# Altium schematic sheet Peripheral_Sheet.SchDoc
size 420 x 297 mm; SheetNumber: 4; SheetTotal: 5
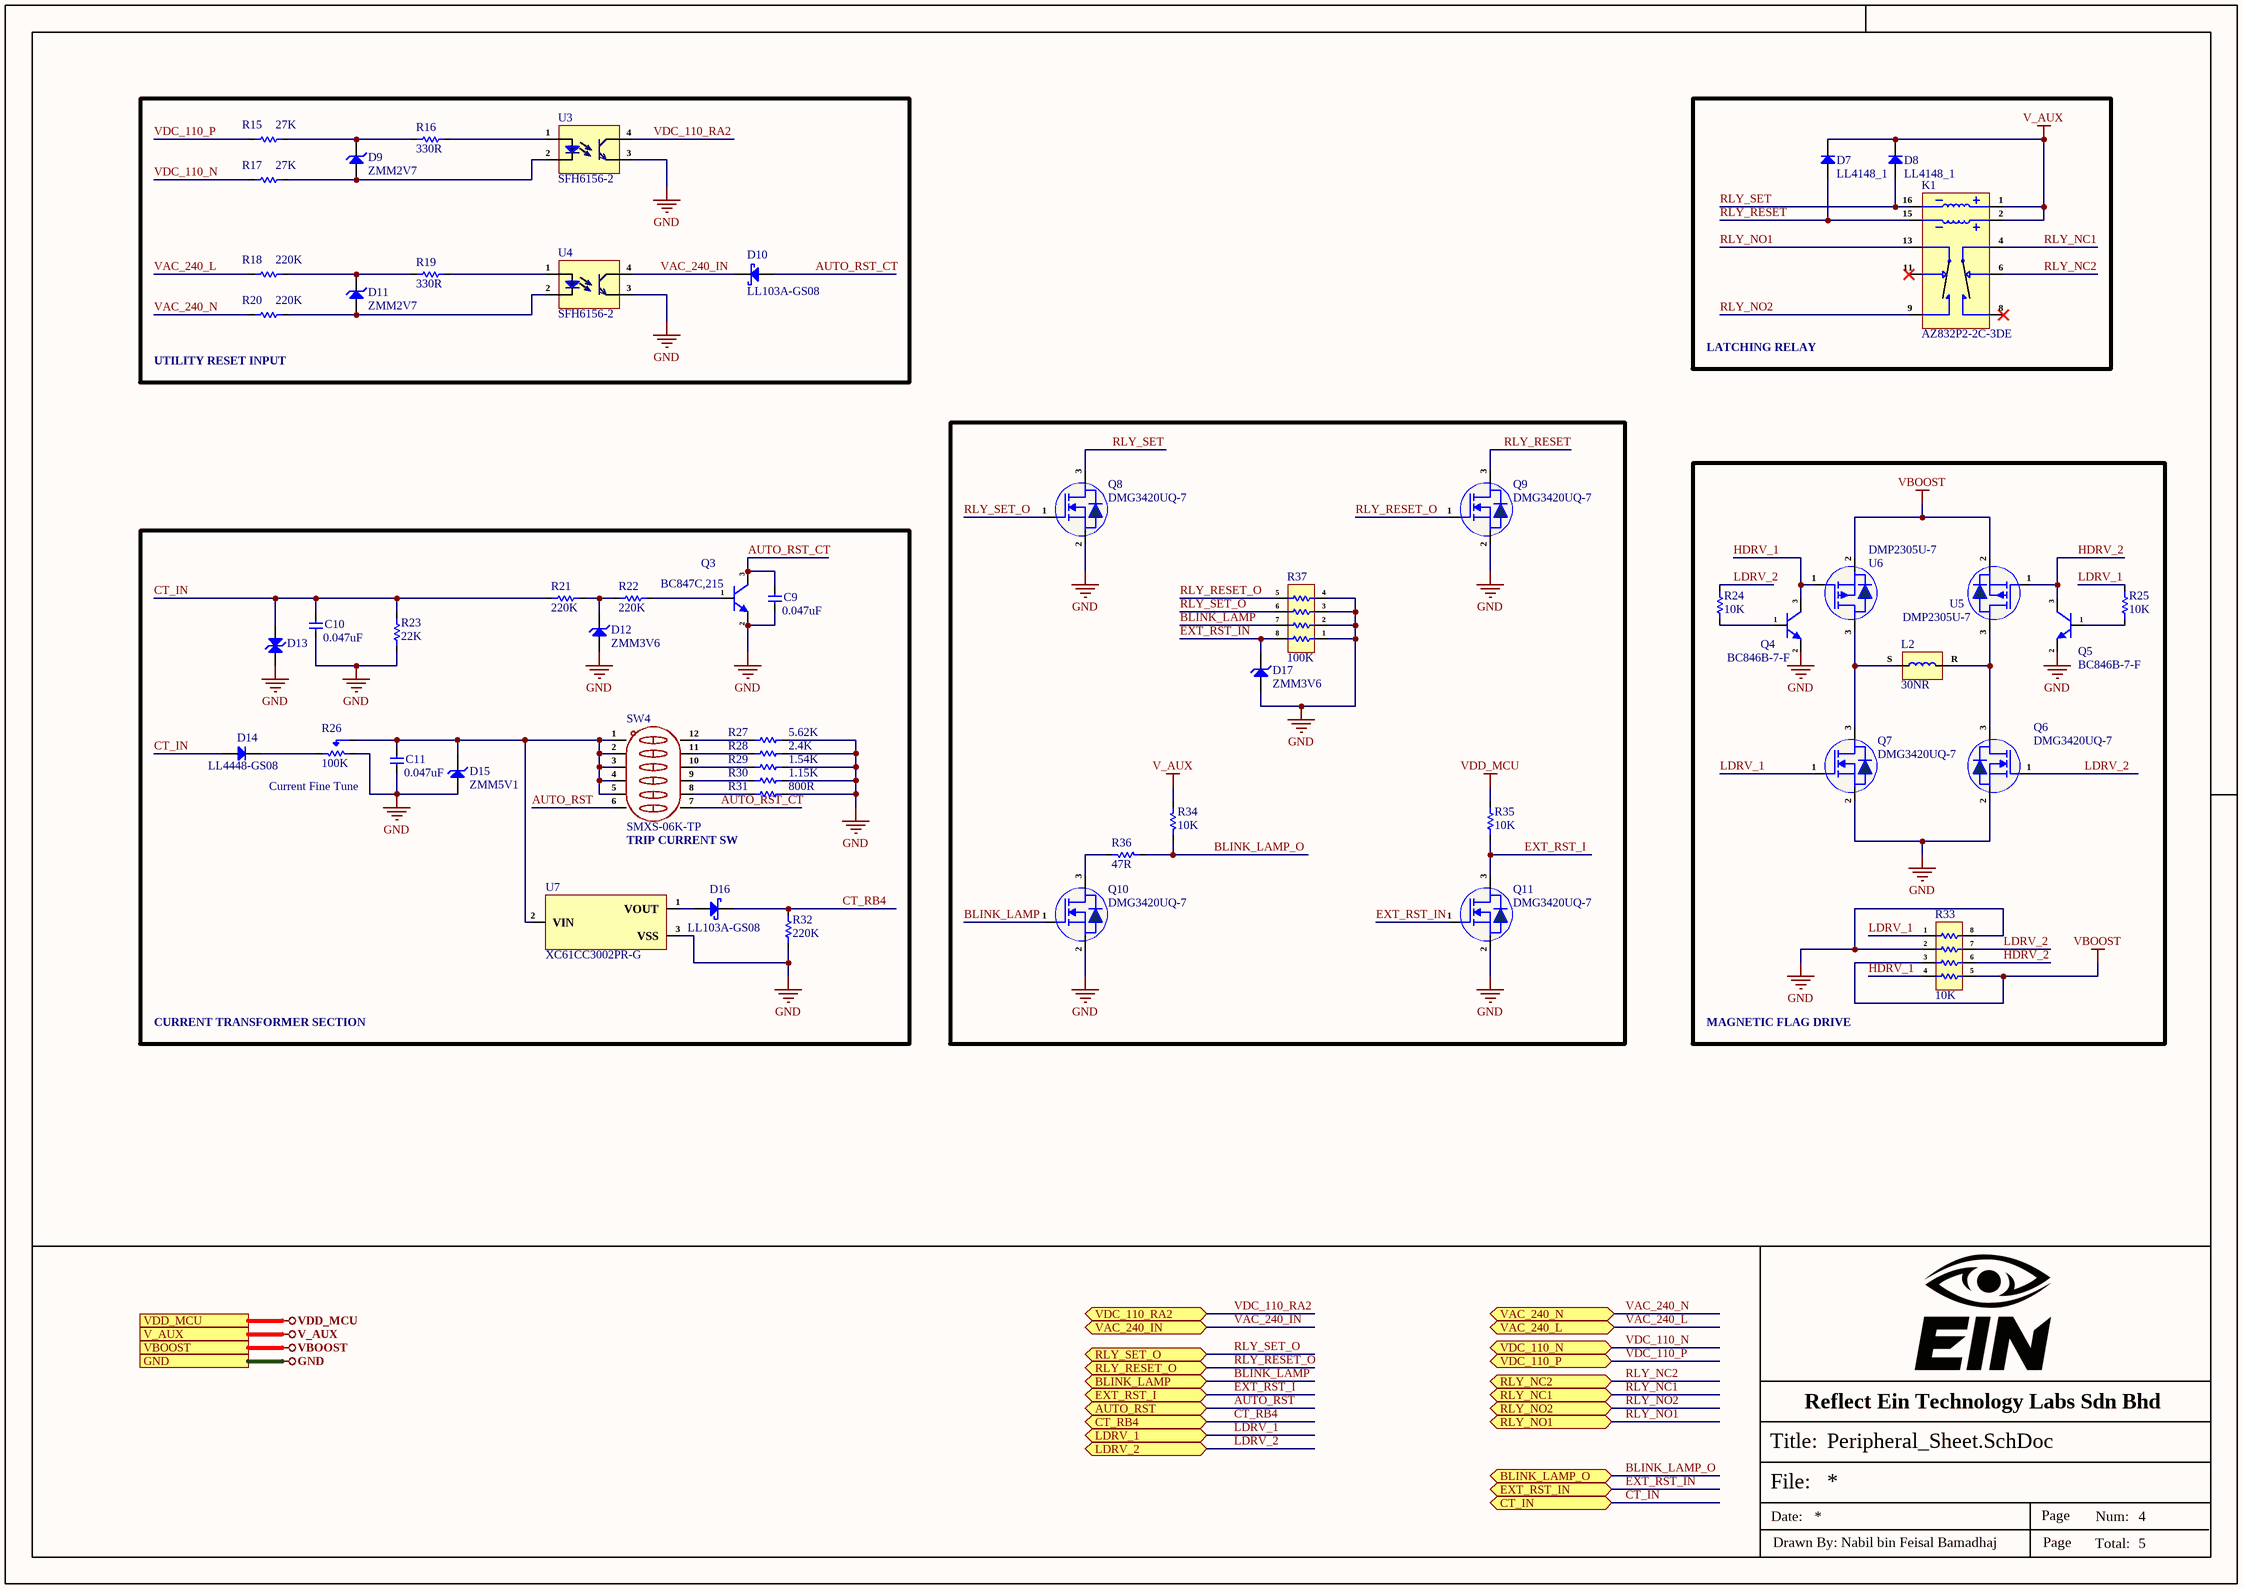
[diagram p0: Peripheral_Sheet.SchDoc]

## Parts
C9  0.047uF  [Cap-1206]
C10  0.047uF  [Cap-1206]
C11  0.047uF  [Cap-1206]
D7  LL4148_1  [LL-34]
D8  LL4148_1  [LL-34]
D9  ZMM2V7  [LL-34]
D10  LL103A-GS08  [LL-34]
D11  ZMM2V7  [LL-34]
D12  ZMM3V6  [LL-34]
D13  SMAJ110CA-E3/5A  [SMA Bi Directional]  (value not drawn)
D14  LL4448-GS08  [LL-34]
D15  ZMM5V1  [LL-34]
D16  LL103A-GS08  [LL-34]
D17  ZMM3V6  [LL-34]
K1  AZ832P2-2C-3DE  [AZ832P2-2C-3DE]
L2  30NR  [30NR]
Q3  BC847C,215  [SOT-23]
Q4  BC846B-7-F  [SOT-23]
Q5  BC846B-7-F  [SOT-23]
Q6  DMG3420UQ-7  [SOT-23]
Q7  DMG3420UQ-7  [SOT-23]
Q8  DMG3420UQ-7  [SOT-23]
Q9  DMG3420UQ-7  [SOT-23]
Q10  DMG3420UQ-7  [SOT-23]
Q11  DMG3420UQ-7  [SOT-23]
R15  27K  [Res-1206]
R16  330R  [Res-1206]
R17  27K  [Res-1206]
R18  220K  [Res-1206]
R19  330R  [Res-1206]
R20  220K  [Res-1206]
R21  220K  [Res-1206]
R22  220K  [Res-1206]
R23  22K  [Res-1206]
R24  10K  [Res-1206]
R25  10K  [Res-1206]
R26  100K  [T93YA104KT20]
R27  5.62K  [Res-1206]
R28  2.4K  [Res-1206]
R29  1.54K  [Res-1206]
R30  1.15K  [Res-1206]
R31  800R  [Res-1206]
R32  220K  [Res-1206]
R33  10K  [0603x4]
R34  10K  [Res-1206]
R35  10K  [Res-1206]
R36  47R  [Res-1206]
R37  100K  [YC164-JR-070RL]
SW4  SMXS-06K-TP  [SMXS-06K-TP]
U3  SFH6156-2  [SFH6156-2]
U4  SFH6156-2  [SFH6156-2]
U5  DMP2305U-7  [SOT-23]
U6  DMP2305U-7  [SOT-23]
U7  XC61CC3002PR-G  [SOT-89-3]

## Blocks framed on the sheet
UTILITY RESET INPUT: D9-D11 R15-R20 U3 U4
LATCHING RELAY: D7 D8 K1
MAGNETIC FLAG DRIVE: L2 Q4-Q7 R24 R25 R33 U5 U6

## Ports
AUTO_RST (bidir, see Top-Sheet[4B], Controller_Sheet[4D]), BLINK_LAMP (bidir, see Top-Sheet[4B], Controller_Sheet[4D]), BLINK_LAMP_O (bidir, see Top-Sheet[4B], Connector_Sheet[4D]), CT_IN (bidir, see Top-Sheet[4B], Connector_Sheet[4D]), CT_RB4 (bidir, see Top-Sheet[4B], Controller_Sheet[4D]), EXT_RST_I (bidir, see Top-Sheet[4B], Controller_Sheet[4D]), EXT_RST_IN (bidir, see Top-Sheet[4B], Connector_Sheet[4D]), GND (see Top-Sheet[4B], Connector_Sheet[1D], Controller_Sheet[1D], Power_Sheet[1D]), LDRV_1 (bidir, see Top-Sheet[4B], Controller_Sheet[4D]), LDRV_2 (bidir, see Top-Sheet[4B], Controller_Sheet[4D]), RLY_NC1 (bidir, see Top-Sheet[4B], Connector_Sheet[4D]), RLY_NC2 (bidir, see Top-Sheet[4B], Connector_Sheet[4D]), RLY_NO1 (bidir, see Top-Sheet[4B], Connector_Sheet[4D]), RLY_NO2 (bidir, see Top-Sheet[4B], Connector_Sheet[4D]), RLY_RESET_O (bidir, see Top-Sheet[4B], Controller_Sheet[4D]), RLY_SET_O (bidir, see Top-Sheet[4B], Controller_Sheet[4D]), V_AUX (see Top-Sheet[4A], Connector_Sheet[1D], Power_Sheet[1D]), VAC_240_IN (bidir, see Top-Sheet[4B], Controller_Sheet[4D]), VAC_240_L (bidir, see Top-Sheet[4B], Connector_Sheet[4D]), VAC_240_N (bidir, see Top-Sheet[4B], Connector_Sheet[4D]), VBOOST (see Top-Sheet[4B], Power_Sheet[1D]), VDC_110_N (bidir, see Top-Sheet[4B], Connector_Sheet[4D]), VDC_110_P (bidir, see Top-Sheet[4B], Connector_Sheet[4D]), VDC_110_RA2 (bidir, see Top-Sheet[4B], Controller_Sheet[4D]), VDD_MCU (see Top-Sheet[4A], Controller_Sheet[1D], Power_Sheet[1D])

## Nets
GND: C9.1 C10.1 C11.1 D12.2(A) D13.1(A) D15.2(A) D17.2(A) Q3.2(E) Q4.2(E) Q5.2(E) Q6.2(S) Q7.2(S) Q8.2(S) Q9.2(S) Q10.2(S) Q11.2(S) R23.1 R26.1(CCW) R27.2 R28.2 R29.2 R30.2 R31.2 R32.2 R33.2 R33.8 R37.1 R37.2 R37.3 R37.4 U3.3(E) U4.3(E) U7.3(VSS) ; port GND
V_AUX: D7.1(K) D8.1(K) K1.1 K1.2 R34.2 ; port V_AUX
VBOOST: R33.3 R33.5 U5.2(S) U6.2(S) ; port VBOOST
VDD_MCU: R35.2 ; port VDD_MCU
AUTO_RST: SW4.6 ; port AUTO_RST
AUTO_RST_CT: C9.2 D10.2(A) Q3.3(C) SW4.7
BLINK_LAMP: Q10.1(G) R37.7 ; port BLINK_LAMP
BLINK_LAMP_O: R34.1 R36.1 ; port BLINK_LAMP_O
CT_IN: C10.2 D13.2(A) D14.2(A) R21.2 R23.2 ; port CT_IN
CT_RB4: D16.1(K) R32.1 ; port CT_RB4
EXT_RST_I: Q11.3(D) R35.1 ; port EXT_RST_I
EXT_RST_IN: D17.1(K) Q11.1(G) R37.8 ; port EXT_RST_IN
HDRV_1: Q4.3(C) R33.4 U6.1(G)
HDRV_2: Q5.3(C) R33.6 U5.1(G)
LDRV_1: Q7.1(G) R25.2 R33.1 ; port LDRV_1
LDRV_2: Q6.1(G) R24.2 R33.7 ; port LDRV_2
RLY_NC1: K1.4 ; port RLY_NC1
RLY_NC2: K1.6 ; port RLY_NC2
RLY_NO1: K1.13 ; port RLY_NO1
RLY_NO2: K1.9 ; port RLY_NO2
RLY_RESET: D7.2(A) K1.15 Q9.3(D)
RLY_RESET_O: Q9.1(G) R37.5 ; port RLY_RESET_O
RLY_SET: D8.2(A) K1.16 Q8.3(D)
RLY_SET_O: Q8.1(G) R37.6 ; port RLY_SET_O
VAC_240_IN: D10.1(K) U4.4(C) ; port VAC_240_IN
VAC_240_L: R18.2 ; port VAC_240_L
VAC_240_N: R20.2 ; port VAC_240_N
VDC_110_N: R17.1 ; port VDC_110_N
VDC_110_P: R15.1 ; port VDC_110_P
VDC_110_RA2: U3.4(C) ; port VDC_110_RA2
NetC11_2: C11.2 D15.1(K) R26.2(Wiper) SW4.1 SW4.2 SW4.3 SW4.4 SW4.5 U7.2(VIN)
NetD9_1: D9.1(K) R15.2 R16.1
NetD9_2: D9.2(A) R17.2 U3.2(Ca)
NetD11_1: D11.1(K) R18.1 R19.1
NetD11_2: D11.2(A) R20.1 U4.2(Ca)
NetD12_1: D12.1(K) R21.1 R22.2
NetD14_1: D14.1(K) R26.3(CW)
NetD16_2: D16.2(A) U7.1(VOUT)
NetL2_R: L2.R Q6.3(D) U5.3(D)
NetL2_S: L2.S Q7.3(D) U6.3(D)
NetQ3_1: Q3.1(B) R22.1
NetQ4_1: Q4.1(B) R24.1
NetQ5_1: Q5.1(B) R25.1
NetQ10_3: Q10.3(D) R36.2
NetR16_2: R16.2 U3.1(An)
NetR19_2: R19.2 U4.1(An)
NetR27_1: R27.1 SW4.12
NetR28_1: R28.1 SW4.11
NetR29_1: R29.1 SW4.10
NetR30_1: R30.1 SW4.9
NetR31_1: R31.1 SW4.8

Not connected (* = marked no-connect by the designer): K1 8* 11*

## Notes on the sheet
- Current Fine Tune
- (near SW4) TRIP CURRENT SW
- CURRENT TRANSFORMER SECTION
- Reflect Ein Technology Labs Sdn Bhd
- File:
- Title:
- Date:
- Page
- Num:
- Total:
- Drawn By: Nabil bin Feisal Bamadhaj

## Library data of the parts
C9-C11 = CC1206JRX7R0BB473: CAP CER 0.047UF 100V X7R 1206; Manufacturer: Yageo; Tolerance: 5%; Capacitance: 47nF; Item Type: Capacitor; Supplier 1: Arrow Electronics; Manufacturer Part Number: CC1206JRX7R0BB473; RoHS: Yes; Category: Ceramic Capacitors; Stock 1: 6600; Pricing 1: 1=0.21620, 10=0.10530, 25=0.10420, 100=0.08480, 250=0.08390, 500=0.05860, 1000=0.05090, 3000=0.04900, 6000=0.02930 (USD); Mount: Surface Mount; Case/Package: 1206; Case Code (Imperial): 1206; Case Code (Metric): 3216; Min Operating Temperature: -55°C; Max Operating Temperature: 125°C; Packaging: Tape and Reel; Voltage Rating (DC): 100V; Dielectric: X7R; Termination: SMD/SMT; Resistor Type: Ceramic; Voltage Rating: 100V; Series: CC; Construction: Flat; Length: 3.2mm; Width: 1.6mm; Height: 0.85mm; Thickness: 0.037inch; Depth: 1.6mm; Radiation Hardening: No; RoHS Compliant: Yes; ComponentLink1URL: https://datasheet.ciiva.com/11465/upy-np0x7r-mv-100-to-630v-9-11465413.pdf?src-supplier=Avnet; ComponentLink1Description: https://datasheet.ciiva.com/11465/upy-np0x7r-mv-100-to-630v-9-11465413.pdf?src-supplier=Avnet; ComponentLink2URL: https://datasheet.ciiva.com/13210/upy-gp-np0-16v-to-50v-8-13210277.pdf?src-supplier=Mouser; ComponentLink2Description: https://datasheet.ciiva.com/13210/upy-gp-np0-16v-to-50v-8-13210277.pdf?src-supplier=Mouser; Supplier Part Number 1: CC1206JRX7R0BB473; LCSC Part Number: C577197
D7 D8 = LL4148_1: 100V 1V@50mA 4ns 300mA LL-34 Switching Diodes ROHS; Manufacturer: Yangzhou Yangjie Elec Tech; Manufacturer Part Number: LL4148; Item Type: Diode; Package: LL-34; LCSC Part Number: C211750; ComponentLink1Description: LCSC; ComponentLink1URL: https://www.lcsc.com/product-detail/Switching-Diodes_Yangzhou-Yangjie-Elec-Tech-LL4148_C211750.html
D9 D11 = ZMM2V7: Independent Type 2.5V~2.9V 500mW 2.7V LL-34 Zener Diodes ROHS; Manufacturer: HXY MOSFET; Item Type: Diode; Manufacturer Part Number: ZMM2V7; Package: LL-34; LCSC Part Number: C2891738; ComponentLink1Description: LCSC; ComponentLink1URL: https://www.lcsc.com/product-detail/Zener-Diodes_YONGYUTAI-ZMM2V7_C2891738.html
D10 D16 = LL103A-GS08: DIODE SCHOTTKY 40V 200MA SOD80; Manufacturer: Vishay; Item Type: Schottky Diodes; Body Material: Glass; Value: 50pF; Current Rating: 400A; Element Configuration: Single; Forward Voltage: 370mV; Max Forward Surge Current (Ifsm): 15A; Max Junction Temperature (Tj): 125°C; Max Power Dissipation: 400mW; Max Reverse Leakage Current: 5µA; Number of Elements: 1; Recovery Time: 10ns; Supplier: Avnet; LCSC Part Number: C2979792; Manufacturer Part Number: LL103A-GS08; RoHS: Compliant; Stock: 37500; Pricing: 12500=0.05045 (USD); Average Rectified Current: 200mA; China RoHS: Non-Compliant; Contact Plating: Silver, Tin; Diameter: 1.6mm; Forward Current: 200mA; Height: 1.6mm; Lead Free: Lead Free; Length: 3.7mm; Lifecycle Status: Production; Max Operating Temperature: 125°C; Max Output current: 200mA; Max Repetitive Reverse Voltage (Vrrm): 40V; Max Reverse Voltage (DC): 40V; Max Surge Current: 15A; Min Operating Temperature: -65°C; Mounting Technology: Surface Mount; Pins: 2; Number of Terminals: 2; Packaging: Cut Tape; Peak Non-Repetitive Surge Current: 15A; Peak Reverse Current: 5µA; Power Dissipation: 400mW; Radiation Hardening: No; REACH SVHC: Yes; Reverse Recovery Time: 10ns; Reverse Standoff Voltage: 40V; Reverse Voltage: 40V; Schedule B: 8541100070, 8541100070|8541100070|8541100070|8541100070|8541100070; Width: 1.6mm; ComponentLink1URL: https://datasheet.octopart.com:443/LL103A-GS08-Vishay-datasheet-181469840.pdf?src-supplier=Farnell; ComponentLink1Description: https://datasheet.octopart.com:443/LL103A-GS08-Vishay-datasheet-181469840.pdf?src-supplier=Farnell; ComponentLink2URL: https://datasheet.octopart.com:443/LL103A-GS08-Vishay-datasheet-10540872.pdf?src-supplier=Farnell; ComponentLink2Description: https://datasheet.octopart.com:443/LL103A-GS08-Vishay-datasheet-10540872.pdf?src-supplier=Farnell; ComponentLink3URL: https://datasheet.octopart.com:443/LL103A-GS08-Vishay-datasheet-8365623.pdf?src-supplier=Farnell; ComponentLink3Description: https://datasheet.octopart.com:443/LL103A-GS08-Vishay-datasheet-8365623.pdf?src-supplier=Farnell; ComponentLink4URL: https://datasheet.octopart.com:443/LL103A-GS08-Vishay-datasheet-11751478.pdf?src-supplier=_legacy+Avnet; ComponentLink4Description: https://datasheet.octopart.com:443/LL103A-GS08-Vishay-datasheet-11751478.pdf?src-supplier=_legacy+Avnet; ComponentLink5URL: https://datasheet.octopart.com:443/LL103A-GS08-Vishay-datasheet-181483661.pdf?src-supplier=IHS; ComponentLink5Description: https://datasheet.octopart.com:443/LL103A-GS08-Vishay-datasheet-181483661.pdf?src-supplier=IHS; ComponentLink6URL: https://datasheet.octopart.com:443/LL103A-GS08-Vishay-datasheet-62318247.pdf?src-supplier=Newark; ComponentLink6Description: https://datasheet.octopart.com:443/LL103A-GS08-Vishay-datasheet-62318247.pdf?src-supplier=Newark; ComponentLink7URL: https://datasheet.octopart.com:443/LL103A-GS08.-Vishay-datasheet-184398164.pdf?src-supplier=Newark; ComponentLink7Description: https://datasheet.octopart.com:443/LL103A-GS08.-Vishay-datasheet-184398164.pdf?src-supplier=Newark; ComponentLink8URL: https://datasheet.octopart.com:443/LL103A-GS08-Vishay-datasheet-21268782.pdf?src-supplier=Newark; ComponentLink8Description: https://datasheet.octopart.com:443/LL103A-GS08-Vishay-datasheet-21268782.pdf?src-supplier=Newark; ComponentLink9URL: https://datasheet.octopart.com:443/LL103A-GS08-Vishay-datasheet-7183.pdf?src-supplier=Newark; ComponentLink9Description: https://datasheet.octopart.com:443/LL103A-GS08-Vishay-datasheet-7183.pdf?src-supplier=Newark; ComponentLink10URL: https://datasheet.octopart.com:443/LL103A-GS08-Vishay-datasheet-5392692.pdf?src-supplier=element14; ComponentLink10Description: https://datasheet.octopart.com:443/LL103A-GS08-Vishay-datasheet-5392692.pdf?src-supplier=element14; ComponentLink11URL: https://datasheet.octopart.com:443/LL103A-GS08-Vishay-datasheet-159617103.pdf?src-supplier=element14+APAC; ComponentLink11Description: https://datasheet.octopart.com:443/LL103A-GS08-Vishay-datasheet-159617103.pdf?src-supplier=element14+APAC; ComponentLink12URL: https://datasheet.octopart.com:443/LL103A-GS08-Vishay-datasheet-42424840.pdf?src-supplier=TME; ComponentLink12Description: https://datasheet.octopart.com:443/LL103A-GS08-Vishay-datasheet-42424840.pdf?src-supplier=TME; ComponentLink13URL: https://datasheet.octopart.com:443/LL103A-GS08-Vishay-datasheet-14186831.pdf?src-supplier=iiiC; ComponentLink13Description: https://datasheet.octopart.com:443/LL103A-GS08-Vishay-datasheet-14186831.pdf?src-supplier=iiiC; ComponentLink14URL: https://datasheet.octopart.com:443/LL103A-GS08-Vishay-datasheet-10014030.pdf?src-supplier=RS+(Formerly+Allied+Electronics); ComponentLink14Description: https://datasheet.octopart.com:443/LL103A-GS08-Vishay-datasheet-10014030.pdf?src-supplier=RS+(Formerly+Allied+Electronics); ComponentLink15URL: https://datasheet.octopart.com:443/LL103A-GS08-Vishay-datasheet-72214.pdf?src-supplier=RS+(Formerly+Allied+Electronics); ComponentLink15Description: https://datasheet.octopart.com:443/LL103A-GS08-Vishay-datasheet-72214.pdf?src-supplier=RS+(Formerly+Allied+Electronics); ComponentLink16URL: http://sigma.octopart.com:80/rohs_statement/Vishay-company-15.pdf?src-supplier=Compliance+Statements; ComponentLink16Description: http://sigma.octopart.com:80/rohs_statement/Vishay-company-15.pdf?src-supplier=Compliance+Statements
D12 D17 = ZMM3V6: Independent Type 500mW 3.4V~3.8V 3.6V LL-34 Zener Diodes ROHS; Manufacturer: HXY MOSFET; Item Type: Diode; Manufacturer Part Number: ZMM3V6; Package: LL-34; LCSC Part Number: C5345988; ComponentLink1Description: LCSC; ComponentLink1URL: https://www.lcsc.com/product-detail/Zener-Diodes_HXY-MOSFET-ZMM3V6_C5345988.html
D13 = SMAJ110CA-E3/5A: TVS DIODE 110VWM 177VC DO214AC; Manufacturer: Vishay; Item Type: TVS Diodes; Breakdown Voltage: 128.5V; Clamping Voltage: 177V; Direction: Bidirectional; Element Configuration: Single; Leakage Current: 1µA; Max Breakdown Voltage: 135V; Max Forward Surge Current (Ifsm): 40A; Max Power Dissipation: 3.3W; Max Surge Current: 1.7A; Min Breakdown Voltage: 122V; Number of Bidirectional Channels: 1; Operating Supply Voltage: 110V; Peak Pulse Power: 300W; Power Line Protection: No; Test Current: 1mA; Supplier: DigiKey; LCSC Part Number: C6229597; Manufacturer Part Number: SMAJ110CA-E3/5A; RoHS: Compliant; Pricing: 7500=0.09372, 15000=0.08595, 22500=0.08198, 37500=0.07753, 52500=0.07489, 75000=0.07233 (USD); Case/Package: SMA; China RoHS: Non-Compliant; Composition: Zener; Lifecycle Status: Production; Max Operating Temperature: 150°C; Max Reverse Leakage Current: 1µA; Min Operating Temperature: -55°C; Number of Channels: 1; Number of Elements: 1; Pins: 2; Number of Terminals: 2; Packaging: Tape and Reel; Peak Pulse Current: 1.7A; Peak Reverse Current: 1µA; Polarity: Bidirectional; REACH SVHC: No; Reverse Breakdown Voltage: 122V; Reverse Standoff Voltage: 110V; ComponentLink1URL: https://datasheet.octopart.com:443/SMAJ110CA-E3-5A-Vishay-datasheet-155938759.pdf?src-supplier=IHS; ComponentLink1Description: https://datasheet.octopart.com:443/SMAJ110CA-E3-5A-Vishay-datasheet-155938759.pdf?src-supplier=IHS; ComponentLink2URL: https://datasheet.octopart.com:443/SMAJ110CA-E3-5A-Vishay-Semiconductor-datasheet-15599035.pdf?src-supplier=Upverter; ComponentLink2Description: https://datasheet.octopart.com:443/SMAJ110CA-E3-5A-Vishay-Semiconductor-datasheet-15599035.pdf?src-supplier=Upverter; ComponentLink3URL: http://sigma.octopart.com:80/rohs_statement/Vishay-company-15.pdf?src-supplier=Compliance+Statements; ComponentLink3Description: http://sigma.octopart.com:80/rohs_statement/Vishay-company-15.pdf?src-supplier=Compliance+Statements
D14 = LL4448-GS08: DIODE STANDARD 75V 150MA SOD80C; Manufacturer: Vishay; Item Type: Rectifier Diodes; Body Material: Glass; Value: 4pF; Current: 500mA; Element Configuration: Single; Forward Current: 300mA; Forward Voltage: 1V; Max Forward Surge Current (Ifsm): 2A; Max Junction Temperature (Tj): 175°C; Max Power Dissipation: 500mW; Max Repetitive Reverse Voltage (Vrrm): 100V; Max Reverse Leakage Current: 5µA; Number of Elements: 1; Recovery Time: 8ns; Supplier: Avnet; LCSC Part Number: C19078472; Manufacturer Part Number: LL4448-GS08; RoHS: Compliant; Stock: 12093; Pricing: 1=0.105, 25=0.072, 100=0.06, 250=0.053, 500=0.043 (USD); Average Rectified Current: 150mA; China RoHS: Non-Compliant; Contact Plating: Silver, Tin; Diameter: 1.6mm; Height: 1.6mm; Lead Free: Lead Free; Length: 3.683mm; Lifecycle Status: Production; Max Operating Temperature: 175°C; Max Output current: 150mA; Max Reverse Voltage (DC): 75V; Max Surge Current: 2A; Min Breakdown Voltage: 100V; Min Operating Temperature: -65°C; Mounting Technology: Surface Mount; Pins: 2; Number of Terminals: 2; Packaging: Cut Tape; Peak Non-Repetitive Surge Current: 2A; Peak Reverse Current: 5µA; Power Dissipation: 500mW; Radiation Hardening: No; REACH SVHC: No; Reverse Recovery Time: 8ns; Reverse Standoff Voltage: 75V; Reverse Voltage: 75V; Schedule B: 8541100070, 8541100070|8541100070|8541100070|8541100070|8541100070; Termination: SMD/SMT; Voltage: 75V; ComponentLink1URL: https://datasheet.octopart.com:443/LL4448-GS08-Vishay-datasheet-165827647.pdf?src-supplier=Newark; ComponentLink1Description: https://datasheet.octopart.com:443/LL4448-GS08-Vishay-datasheet-165827647.pdf?src-supplier=Newark; ComponentLink2URL: https://datasheet.octopart.com:443/LL4448-GS08-Vishay-datasheet-62318255.pdf?src-supplier=Newark; ComponentLink2Description: https://datasheet.octopart.com:443/LL4448-GS08-Vishay-datasheet-62318255.pdf?src-supplier=Newark; ComponentLink3URL: https://datasheet.octopart.com:443/LL4448-GS08-Vishay-datasheet-34180280.pdf?src-supplier=Newark; ComponentLink3Description: https://datasheet.octopart.com:443/LL4448-GS08-Vishay-datasheet-34180280.pdf?src-supplier=Newark; ComponentLink4URL: https://datasheet.octopart.com:443/LL4448-GS08-Vishay-datasheet-5440278.pdf?src-supplier=Newark; ComponentLink4Description: https://datasheet.octopart.com:443/LL4448-GS08-Vishay-datasheet-5440278.pdf?src-supplier=Newark; ComponentLink5URL: https://datasheet.octopart.com:443/LL4448-GS08-Vishay-Semiconductor-datasheet-33013835.pdf?src-supplier=Newark; ComponentLink5Description: https://datasheet.octopart.com:443/LL4448-GS08-Vishay-Semiconductor-datasheet-33013835.pdf?src-supplier=Newark; ComponentLink6URL: https://datasheet.octopart.com:443/LL4448-GS08-Vishay-datasheet-8477288.pdf?src-supplier=_legacy+Avnet; ComponentLink6Description: https://datasheet.octopart.com:443/LL4448-GS08-Vishay-datasheet-8477288.pdf?src-supplier=_legacy+Avnet; ComponentLink7URL: https://datasheet.octopart.com:443/LL4448-GS08-Vishay-datasheet-12511824.pdf?src-supplier=_legacy+Avnet; ComponentLink7Description: https://datasheet.octopart.com:443/LL4448-GS08-Vishay-datasheet-12511824.pdf?src-supplier=_legacy+Avnet; ComponentLink8URL: https://datasheet.octopart.com:443/LL4448-GS08-Vishay-datasheet-8854176.pdf?src-supplier=_legacy+Avnet; ComponentLink8Description: https://datasheet.octopart.com:443/LL4448-GS08-Vishay-datasheet-8854176.pdf?src-supplier=_legacy+Avnet; ComponentLink9URL: https://datasheet.octopart.com:443/LL4448-GS08-Vishay-datasheet-181483663.pdf?src-supplier=IHS; ComponentLink9Description: https://datasheet.octopart.com:443/LL4448-GS08-Vishay-datasheet-181483663.pdf?src-supplier=IHS; ComponentLink10URL: https://datasheet.octopart.com:443/LL4448-GS08-Vishay-datasheet-616916.pdf?src-supplier=element14; ComponentLink10Description: https://datasheet.octopart.com:443/LL4448-GS08-Vishay-datasheet-616916.pdf?src-supplier=element14; ComponentLink11URL: https://datasheet.octopart.com:443/LL4448-GS08-Vishay-datasheet-170554758.pdf?src-supplier=Burklin+Elektronik; ComponentLink11Description: https://datasheet.octopart.com:443/LL4448-GS08-Vishay-datasheet-170554758.pdf?src-supplier=Burklin+Elektronik; ComponentLink12URL: https://datasheet.octopart.com:443/LL4448-GS08-Vishay-datasheet-152532718.pdf?src-supplier=TME; ComponentLink12Description: https://datasheet.octopart.com:443/LL4448-GS08-Vishay-datasheet-152532718.pdf?src-supplier=TME; ComponentLink13URL: https://datasheet.octopart.com:443/LL4448-GS08-Vishay-datasheet-41857211.pdf?src-supplier=TME; ComponentLink13Description: https://datasheet.octopart.com:443/LL4448-GS08-Vishay-datasheet-41857211.pdf?src-supplier=TME; ComponentLink14URL: https://datasheet.octopart.com:443/LL4448-GS08-Vishay-datasheet-101751515.pdf?src-supplier=Future+Electronics; ComponentLink14Description: https://datasheet.octopart.com:443/LL4448-GS08-Vishay-datasheet-101751515.pdf?src-supplier=Future+Electronics; ComponentLink15URL: https://datasheet.octopart.com:443/LL4448-GS08-Vishay-datasheet-9640167.pdf?src-supplier=RS+(Formerly+Allied+Electronics); ComponentLink15Description: https://datasheet.octopart.com:443/LL4448-GS08-Vishay-datasheet-9640167.pdf?src-supplier=RS+(Formerly+Allied+Electronics); ComponentLink16URL: https://datasheet.octopart.com:443/LL4448-GS08-Vishay-datasheet-76570.pdf?src-supplier=RS+(Formerly+Allied+Electronics); ComponentLink16Description: https://datasheet.octopart.com:443/LL4448-GS08-Vishay-datasheet-76570.pdf?src-supplier=RS+(Formerly+Allied+Electronics); ComponentLink17URL: http://sigma.octopart.com:80/rohs_statement/Vishay-company-15.pdf?src-supplier=Compliance+Statements; ComponentLink17Description: http://sigma.octopart.com:80/rohs_statement/Vishay-company-15.pdf?src-supplier=Compliance+Statements
D15 = ZMM5V1: Independent 4.8V~5.4V 500mW 5.1V LL-34 Single Zener Diodes RoHS; Manufacturer: HXY MOSFET; Item Type: Diode; Manufacturer Part Number: ZMM5V1; Package: LL-34; LCSC Part Number: C5345992; ComponentLink1Description: LCSC; ComponentLink1URL: https://www.lcsc.com/product-detail/C5345992.html?s_z=n_ZMM5V1
K1 = AZ832P2-2C-3DE: Magnetic Latching Relays ROHS; Manufacturer: ZETTLER; Item Type: Relay; Manufacturer Part Number: AZ832P2-2C-3DE; Package: Custom; LCSC Part Number: C20262850; ComponentLink1Description: LCSC; ComponentLink1URL: https://www.lcsc.com/product-detail/Magnetic-Latching-Relays_ZETTLER-AZ832P2-2C-3DE_C20262850.html?s_z=n_AZ832P2-2C-3DE
L2 = 30NR: Magnetic Status Indicator
Q3 = BC847C,215: TRANS NPN 45V 0.1A TO-236AB; Manufacturer: Nexperia; Item Type: BJTs; Polarity: 5054Direction; Supplier: Future Electronics; LCSC Part Number: C8664; Manufacturer Part Number: BC847C,215; RoHS: Yes; Stock: 18000; Pricing: 3000=0.0084, 12000=0.0081, 30000=0.0079, 75000=0.0077, 120000=0.0074 (USD); Pins: 3NUMBER; Packaging: 13Packaging; RoHS Compliant: Yes; ComponentLink1URL: http://www.farnell.com/datasheets/1856333.pdf?src-supplier=Farnell; ComponentLink1Description: http://www.farnell.com/datasheets/1856333.pdf?src-supplier=Farnell; ComponentLink2URL: https://assets.nexperia.com/documents/data-sheet/BC847_SER.pdf?src-supplier=Digikey; ComponentLink2Description: https://assets.nexperia.com/documents/data-sheet/BC847_SER.pdf?src-supplier=Digikey; ComponentLink3URL: https://datasheet.octopart.com/BC847C%2C215-NXP-Semiconductors-datasheet-20734447.pdf?src-supplier=Farnell; ComponentLink3Description: https://datasheet.octopart.com/BC847C%2C215-NXP-Semiconductors-datasheet-20734447.pdf?src-supplier=Farnell; ComponentLink4URL: https://datasheet.octopart.com/BC847C%2C215-Nexperia-datasheet-164345412.pdf?src-supplier=Future+Electronics; ComponentLink4Description: https://datasheet.octopart.com/BC847C%2C215-Nexperia-datasheet-164345412.pdf?src-supplier=Future+Electronics; ComponentLink5URL: https://datasheet.octopart.com/BC847C%2C215-Nexperia-datasheet-11982477.pdf?src-supplier=Newark; ComponentLink5Description: https://datasheet.octopart.com/BC847C%2C215-Nexperia-datasheet-11982477.pdf?src-supplier=Newark; ComponentLink6URL: https://datasheet.octopart.com/BC847C%2C215-Nexperia-datasheet-5341283.pdf?src-supplier=TME; ComponentLink6Description: https://datasheet.octopart.com/BC847C%2C215-Nexperia-datasheet-5341283.pdf?src-supplier=TME
Q4 Q5 = BC846B-7-F: TRANS NPN 65V 0.1A SOT23-3; Manufacturer: Diodes; Item Type: Transistors; Supplier: Future Electronics; Supplier Part Number: 3888237; Manufacturer Part Number: BC846B-7-F; RoHS: Yes; Category: BJTs; Stock: 4416000; Pricing: 3000=0.0363, 12000=0.0348, 45000=0.0335, 120000=0.0325, 300000=0.0309 (USD); ComponentLink1URL: https://datasheet.ciiva.com/15139/getdatasheetpartid-139519-15139459.pdf?src-supplier=Verical; ComponentLink1Description: https://datasheet.ciiva.com/15139/getdatasheetpartid-139519-15139459.pdf?src-supplier=Verical; ComponentLink2URL: https://datasheet.ciiva.com/22711/1911717-22711685.pdf?src-supplier=Element14; ComponentLink2Description: https://datasheet.ciiva.com/22711/1911717-22711685.pdf?src-supplier=Element14; LCSC Part Number: C183643
Q6-Q11 = DMG3420UQ-7: MOSFET BVDSS: 8V~24V SOT23 T&R 3; Manufacturer: Diodes; Item Type: MOSFETs; Supplier: Digikey; LCSC Part Number: C5157847; Manufacturer Part Number: DMG3420UQ-7; RoHS: Yes; Stock: 5879; Pricing: 1=0.45, 10=0.276, 100=0.1748, 500=0.1308, 1000=0.11658 (USD); RoHS Compliant: Yes
R15 R17 = FRC1206F2702TS: 250mW Thick Film Resistors 200V ±100ppm/℃ ±1% 27kΩ 1206 Chip Resistor - Surface Mount ROHS; Manufacturer: FOJAN; Manufacturer Part Number: FRC1206F2702TS; Package: 1206; LCSC Part Number: C2960927; Item Type: Resistor; ComponentLink1Description: LCSC; ComponentLink1URL: https://www.lcsc.com/product-detail/Chip-Resistor-Surface-Mount_FOJAN-FRC1206F2702TS_C2960927.html
R16 R19 = FRC1206F3300TS: 250mW Thick Film Resistors 200V ±100ppm/℃ ±1% 330Ω 1206 Chip Resistor - Surface Mount ROHS; Manufacturer: FOJAN; Manufacturer Part Number: FRC1206F3300TS; Package: 1206; LCSC Part Number: C2933675; Item Type: Resistor; ComponentLink1Description: LCSC; ComponentLink1URL: https://www.lcsc.com/product-detail/Chip-Resistor-Surface-Mount_FOJAN-FRC1206F3300TS_C2933675.html
R18 R20-R22 R32 = RT1206BRD07220KL: RES SMD 220K OHM 0.1% 1/4W 1206; Manufacturer: Yageo; Item Type: Resistors; Voltage Rating (DC): 200V; Supplier: Digikey; LCSC Part Number: C309663; Manufacturer Part Number: RT1206BRD07220KL; RoHS: Yes; Stock: 10004; Pricing: 1=0.34, 10=0.225, 50=0.1816, 100=0.1663, 500=0.1326, 1000=0.11628 (USD); Lead Free: 5697LeadFree; ComponentLink1URL: https://datasheet.ciiva.com/2587/pyu-rt-1-to-0-05-rohs-l-5-2587527.pdf?src-supplier=Digikey; ComponentLink1Description: https://datasheet.ciiva.com/2587/pyu-rt-1-to-0-05-rohs-l-5-2587527.pdf?src-supplier=Digikey
R23 = RT1206BRD0722KL: RES SMD 22K OHM 0.1% 1/4W 1206; Manufacturer: Yageo Group; Item Type: Resistors; Max Power Dissipation: 250mW; Value: 22kΩ; Temperature Coefficient: 25ppm/°C; Voltage Rating: 200V; Supplier: Arrow Electronics; LCSC Part Number: C870559; Manufacturer Part Number: RT1206BRD0722KL; RoHS: Compliant; Stock: 470; Pricing: 1=0.0714, 10=0.054, 25=0.051, 100=0.051, 250=0.046 (USD); Case/Package: 1206; Case Code (Imperial): 1206; Case Code (Metric): 3216; China RoHS: Non-Compliant; Composition: Thin Film; Features: Moisture Resistant; Height: 550µm; Lead Free: Lead Free; Length: 3.0988mm; Lifecycle Status: Production; Max Operating Temperature: 155°C; Min Operating Temperature: -55°C; Mounting Technology: Surface Mount; Number of Terminals: 2; Number of Terminations: 2; Power Dissipation: 250mW; Power Rating: 250mW; REACH SVHC: Yes; Schedule B: 8533210045, 8533210045|8533210045|8533210045|8533210045|8533210045; Termination: SMD/SMT; Tolerance: 0.1%; Voltage Rating (DC): 200V; Width: 1.6mm; Working Voltage: 200V; ComponentLink1URL: https://datasheet.octopart.com:443/RT1206BRD0722KL-Yageo-datasheet-176402239.pdf?src-supplier=Newark; ComponentLink1Description: https://datasheet.octopart.com:443/RT1206BRD0722KL-Yageo-datasheet-176402239.pdf?src-supplier=Newark; ComponentLink2URL: https://datasheet.octopart.com:443/RT1206BRD0722KL-Yageo-datasheet-96443642.pdf?src-supplier=Upverter; ComponentLink2Description: https://datasheet.octopart.com:443/RT1206BRD0722KL-Yageo-datasheet-96443642.pdf?src-supplier=Upverter; ComponentLink3URL: https://datasheet.octopart.com:443/RT1206BRD0722KL-Yageo-datasheet-169971040.pdf?src-supplier=Future+Electronics; ComponentLink3Description: https://datasheet.octopart.com:443/RT1206BRD0722KL-Yageo-datasheet-169971040.pdf?src-supplier=Future+Electronics; ComponentLink4URL: https://datasheet.octopart.com:443/RT1206BRD0722KL-Yageo-Group-datasheet-141265893.pdf?src-supplier=ODG+(Origin+Data+Global); ComponentLink4Description: https://datasheet.octopart.com:443/RT1206BRD0722KL-Yageo-Group-datasheet-141265893.pdf?src-supplier=ODG+(Origin+Data+Global); ComponentLink5URL: https://datasheet.octopart.com/RT1206BRD0722KL-Yageo-datasheet-86813807.pdf; ComponentLink5Description: https://datasheet.octopart.com/RT1206BRD0722KL-Yageo-datasheet-86813807.pdf; ComponentLink6URL: http://sigma.octopart.com:80/rohs_statement/Yageo-company-2.pdf?src-supplier=Compliance+Statements; ComponentLink6Description: http://sigma.octopart.com:80/rohs_statement/Yageo-company-2.pdf?src-supplier=Compliance+Statements; ComponentLink7URL: http://sigma.octopart.com:80/conflict_mineral_statement/Yageo-company-3.pdf?src-supplier=Compliance+Statements; ComponentLink7Description: http://sigma.octopart.com:80/conflict_mineral_statement/Yageo-company-3.pdf?src-supplier=Compliance+Statements
R24 R25 R34 R35 = AC1206FR-7W10KL: RES 10K OHM 1% 1/2W 1206; Manufacturer: Yageo; Item Type: Resistors; Value: 10kR; Supplier: Mouser; LCSC Part Number: C326700; Manufacturer Part Number: AC1206FR-7W10KL; RoHS: No; Stock: 10222; Pricing: 1=0.14, 10=0.052, 50=0.052, 100=0.029, 1000=0.018, 10000=0.011 (USD); Case/Package: 340Case; Packaging: 10Packaging
R26 = T93YA104KT20: TRIMMER 100K OHM 0.5W PC PIN TOP; Manufacturer: Vishay Sfernice; Item Type: Potensiometer; Value: 100kR; Tolerance: 10%; Power Rating: 500mW; Voltage Rating: 250V; Number of Turns: 21; Temperature Coefficient: 100ppm/°C; Supplier: Future Electronics; LCSC Part Number: C7061693; Manufacturer Part Number: T93YA104KT20; RoHS: Yes; Stock: 500; Pricing: 500=0.835, 1000=0.82, 1500=0.815, 2000=0.81, 2500=0.795 (USD); Mounting Technology: PCB,Through Hole; Min Operating Temperature: -55°C; Max Operating Temperature: 155°C; Packaging: Rail/Tube; Series: T93; Technology: CERMET; Package Quantity: 50; Resistor Type: Cermet; Taper: Linear; Termination: Pin; Max Power Dissipation: 500mW; Resistance Tolerance: 10%; Voltage Rating (AC): 250V; Length: 0.382inch; Width: 0.197inch; Height: 0.386inch; Depth: 5mm; Radiation Hardening: No; Lead Free: Lead Free; RoHS Compliant: Yes; Reach SVHC Compliant: Unknown; ComponentLink1URL: https://datasheet.ciiva.com/11831/0900766b80ed9ad6-11831453.pdf?src-supplier=Rs; ComponentLink1Description: https://datasheet.ciiva.com/11831/0900766b80ed9ad6-11831453.pdf?src-supplier=Rs; ComponentLink2URL: https://datasheet.ciiva.com/2156/t93-2156473.pdf?src-supplier=Digikey; ComponentLink2Description: https://datasheet.ciiva.com/2156/t93-2156473.pdf?src-supplier=Digikey; ComponentLink3URL: https://datasheet.ciiva.com/16367/t93-16367128.pdf?src-supplier=Future+Electronics; ComponentLink3Description: https://datasheet.ciiva.com/16367/t93-16367128.pdf?src-supplier=Future+Electronics
R27 = RT1206BRD075K62L: RES SMD 5.62K OHM 0.1% 1/4W 1206; Manufacturer: Yageo Group; Item Type: Resistors; Power Dissipation: 250mW; Value: 5.62kΩ; Temperature Coefficient: 25ppm/°C; Voltage Rating: 200V; Supplier: DigiKey; LCSC Part Number: C870815; Manufacturer Part Number: RT1206BRD075K62L; RoHS: Compliant; Pricing: 5000=0.0862 (USD); Case/Package: 1206; Case Code (Imperial): 1206; Case Code (Metric): 3216; China RoHS: Non-Compliant; Composition: Thin Film; Contact Plating: Tin; Height: 550µm; Lead Free: Lead Free; Length: 3.2mm; Lifecycle Status: Production; Max Operating Temperature: 155°C; Min Operating Temperature: -55°C; Mounting Technology: Surface Mount; Number of Terminals: 2; Power Rating: 250mW; Radiation Hardening: No; REACH SVHC: Yes; Termination: SMD/SMT; Tolerance: 0.1%; Voltage Rating (DC): 200V; Weight: 16.187578mg; Width: 1.6mm; Working Voltage: 200V; ComponentLink1URL: https://datasheet.octopart.com:443/RT1206BRD075K62L-Yageo-datasheet-176402239.pdf?src-supplier=IHS; ComponentLink1Description: https://datasheet.octopart.com:443/RT1206BRD075K62L-Yageo-datasheet-176402239.pdf?src-supplier=IHS; ComponentLink2URL: https://datasheet.octopart.com:443/RT1206BRD075K62L-Yageo-datasheet-96443642.pdf?src-supplier=Upverter; ComponentLink2Description: https://datasheet.octopart.com:443/RT1206BRD075K62L-Yageo-datasheet-96443642.pdf?src-supplier=Upverter; ComponentLink3URL: https://datasheet.octopart.com:443/RT1206BRD075K62L-Yageo-Group-datasheet-141265893.pdf?src-supplier=ODG+(Origin+Data+Global); ComponentLink3Description: https://datasheet.octopart.com:443/RT1206BRD075K62L-Yageo-Group-datasheet-141265893.pdf?src-supplier=ODG+(Origin+Data+Global); ComponentLink4URL: https://datasheet.octopart.com/RT1206BRD075K62L-Yageo-datasheet-86813807.pdf; ComponentLink4Description: https://datasheet.octopart.com/RT1206BRD075K62L-Yageo-datasheet-86813807.pdf; ComponentLink5URL: http://sigma.octopart.com:80/conflict_mineral_statement/Yageo-company-3.pdf?src-supplier=Compliance+Statements; ComponentLink5Description: http://sigma.octopart.com:80/conflict_mineral_statement/Yageo-company-3.pdf?src-supplier=Compliance+Statements; ComponentLink6URL: http://sigma.octopart.com:80/rohs_statement/Yageo-company-2.pdf?src-supplier=Compliance+Statements; ComponentLink6Description: http://sigma.octopart.com:80/rohs_statement/Yageo-company-2.pdf?src-supplier=Compliance+Statements
R28 = RT1206BRD072K4L: RES SMD 2.4K OHM 0.1% 1/4W 1206; Manufacturer: Yageo Group; Item Type: Resistors; Power Dissipation: 250mW; Value: 2.4kΩ; Temperature Coefficient: 25ppm/°C; Voltage Rating: 200V; Supplier: DigiKey; LCSC Part Number: C870627; Manufacturer Part Number: RT1206BRD072K4L; RoHS: Compliant; Stock: 4074; Pricing: 1=0.36, 10=0.255, 25=0.1796, 50=0.157, 100=0.1464, 250=0.1326, 500=0.1173 (USD); Case/Package: 1206; Case Code (Imperial): 1206; Case Code (Metric): 3216; China RoHS: Non-Compliant; Composition: Thin Film; Height: 550µm; Lead Free: Lead Free; Length: 3.1mm; Lifecycle Status: Production; Max Operating Temperature: 155°C; Min Operating Temperature: -55°C; Mounting Technology: Surface Mount; Number of Terminals: 2; Power Rating: 250mW; REACH SVHC: Yes; Termination: SMD/SMT; Tolerance: 0.1%; Voltage Rating (DC): 200V; Weight: 16.187578mg; Width: 1.6mm; Working Voltage: 200V; ComponentLink1URL: https://datasheet.octopart.com:443/RT1206BRD072K4L-Yageo-datasheet-176402239.pdf?src-supplier=Newark; ComponentLink1Description: https://datasheet.octopart.com:443/RT1206BRD072K4L-Yageo-datasheet-176402239.pdf?src-supplier=Newark; ComponentLink2URL: https://datasheet.octopart.com:443/RT1206BRD072K4L-Yageo-datasheet-96443642.pdf?src-supplier=Upverter; ComponentLink2Description: https://datasheet.octopart.com:443/RT1206BRD072K4L-Yageo-datasheet-96443642.pdf?src-supplier=Upverter; ComponentLink3URL: https://datasheet.octopart.com:443/RT1206BRD072K4L-Yageo-Group-datasheet-141265893.pdf?src-supplier=ODG+(Origin+Data+Global); ComponentLink3Description: https://datasheet.octopart.com:443/RT1206BRD072K4L-Yageo-Group-datasheet-141265893.pdf?src-supplier=ODG+(Origin+Data+Global); ComponentLink4URL: https://datasheet.octopart.com/RT1206BRD072K4L-Yageo-datasheet-86813807.pdf; ComponentLink4Description: https://datasheet.octopart.com/RT1206BRD072K4L-Yageo-datasheet-86813807.pdf; ComponentLink5URL: http://sigma.octopart.com:80/rohs_statement/Yageo-company-2.pdf?src-supplier=Compliance+Statements; ComponentLink5Description: http://sigma.octopart.com:80/rohs_statement/Yageo-company-2.pdf?src-supplier=Compliance+Statements; ComponentLink6URL: http://sigma.octopart.com:80/conflict_mineral_statement/Yageo-company-3.pdf?src-supplier=Compliance+Statements; ComponentLink6Description: http://sigma.octopart.com:80/conflict_mineral_statement/Yageo-company-3.pdf?src-supplier=Compliance+Statements
R29 = RT1206BRD071K54L: RES SMD 1.54K OHM 0.1% 1/4W 1206; Manufacturer: Yageo Group; Item Type: Resistors; Max Power Dissipation: 250mW; Value: 1.54kΩ; Temperature Coefficient: 25ppm/°C; Voltage Rating: 200V; Supplier: Arrow Electronics; LCSC Part Number: C870506; Manufacturer Part Number: RT1206BRD071K54L; RoHS: Compliant; Stock: 10000; Pricing: 5000=0.0623, 10000=0.06 (USD); Case/Package: 1206; Case Code (Imperial): 1206; Case Code (Metric): 3216; China RoHS: Non-Compliant; Composition: Thin Film; Contact Plating: Tin; Depth: 1.6mm; Features: Moisture Resistant; Height: 550µm; Lead Free: Lead Free; Length: 3.0988mm; Lifecycle Status: Production; Max Operating Temperature: 155°C; Military Standard: Not; Min Operating Temperature: -55°C; Mounting Technology: Surface Mount; Number of Terminals: 2; Number of Terminations: 2; Power Dissipation: 250mW; Power Rating: 250mW; Radiation Hardening: No; REACH SVHC: Yes; Termination: SMD/SMT; Tolerance: 0.1%; Voltage Rating (DC): 200V; Weight: 16.187578mg; Width: 1.6mm; Working Voltage: 200V; ComponentLink1URL: https://datasheet.octopart.com:443/RT1206BRD071K54L-Yageo-datasheet-176402239.pdf?src-supplier=IHS; ComponentLink1Description: https://datasheet.octopart.com:443/RT1206BRD071K54L-Yageo-datasheet-176402239.pdf?src-supplier=IHS; ComponentLink2URL: https://datasheet.octopart.com:443/RT1206BRD071K54L-Yageo-datasheet-96443642.pdf?src-supplier=Upverter; ComponentLink2Description: https://datasheet.octopart.com:443/RT1206BRD071K54L-Yageo-datasheet-96443642.pdf?src-supplier=Upverter; ComponentLink3URL: https://datasheet.octopart.com:443/RT1206BRD071K54L-Yageo-Group-datasheet-141265893.pdf?src-supplier=ODG+(Origin+Data+Global); ComponentLink3Description: https://datasheet.octopart.com:443/RT1206BRD071K54L-Yageo-Group-datasheet-141265893.pdf?src-supplier=ODG+(Origin+Data+Global); ComponentLink4URL: https://datasheet.octopart.com/RT1206BRD071K54L-Yageo-datasheet-86813807.pdf; ComponentLink4Description: https://datasheet.octopart.com/RT1206BRD071K54L-Yageo-datasheet-86813807.pdf; ComponentLink5URL: http://sigma.octopart.com:80/rohs_statement/Yageo-company-2.pdf?src-supplier=Compliance+Statements; ComponentLink5Description: http://sigma.octopart.com:80/rohs_statement/Yageo-company-2.pdf?src-supplier=Compliance+Statements; ComponentLink6URL: http://sigma.octopart.com:80/conflict_mineral_statement/Yageo-company-3.pdf?src-supplier=Compliance+Statements; ComponentLink6Description: http://sigma.octopart.com:80/conflict_mineral_statement/Yageo-company-3.pdf?src-supplier=Compliance+Statements
R30 = RT1206BRD071K15L: RES SMD 1.15K OHM 0.1% 1/4W 1206; Manufacturer: Yageo Group; Item Type: Resistors; Max Power Dissipation: 250mW; Value: 1.15kΩ; Temperature Coefficient: 25ppm/°C; Voltage Rating: 200V; Supplier: DigiKey; LCSC Part Number: C870491; Manufacturer Part Number: RT1206BRD071K15L; RoHS: Compliant; Pricing: 5000=0.0862 (USD); Case/Package: 1206; Case Code (Imperial): 1206; Case Code (Metric): 3216; China RoHS: Non-Compliant; Composition: Thin Film; Height: 550µm; Lead Free: Lead Free; Length: 3.0988mm; Lifecycle Status: Production; Max Operating Temperature: 155°C; Min Operating Temperature: -55°C; Mounting Technology: Surface Mount; Number of Terminals: 2; Number of Terminations: 2; Power Dissipation: 250mW; Power Rating: 250mW; REACH SVHC: Yes; Termination: SMD/SMT; Tolerance: 0.1%; Voltage Rating (DC): 200V; Width: 1.6mm; Working Voltage: 200V; ComponentLink1URL: https://datasheet.octopart.com:443/RT1206BRD071K15L-Yageo-datasheet-176402239.pdf?src-supplier=IHS; ComponentLink1Description: https://datasheet.octopart.com:443/RT1206BRD071K15L-Yageo-datasheet-176402239.pdf?src-supplier=IHS; ComponentLink2URL: https://datasheet.octopart.com:443/RT1206BRD071K15L-Yageo-datasheet-96443642.pdf?src-supplier=Upverter; ComponentLink2Description: https://datasheet.octopart.com:443/RT1206BRD071K15L-Yageo-datasheet-96443642.pdf?src-supplier=Upverter; ComponentLink3URL: https://datasheet.octopart.com:443/RT1206BRD071K15L-Yageo-datasheet-169971040.pdf?src-supplier=Future+Electronics; ComponentLink3Description: https://datasheet.octopart.com:443/RT1206BRD071K15L-Yageo-datasheet-169971040.pdf?src-supplier=Future+Electronics; ComponentLink4URL: https://datasheet.octopart.com:443/RT1206BRD071K15L-Yageo-datasheet-166250672.pdf?src-supplier=Future+Electronics; ComponentLink4Description: https://datasheet.octopart.com:443/RT1206BRD071K15L-Yageo-datasheet-166250672.pdf?src-supplier=Future+Electronics; ComponentLink5URL: https://datasheet.octopart.com:443/RT1206BRD071K15L-Yageo-datasheet-136673517.pdf?src-supplier=Future+Electronics; ComponentLink5Description: https://datasheet.octopart.com:443/RT1206BRD071K15L-Yageo-datasheet-136673517.pdf?src-supplier=Future+Electronics; ComponentLink6URL: https://datasheet.octopart.com:443/RT1206BRD071K15L-Yageo-datasheet-137700930.pdf?src-supplier=Future+Electronics; ComponentLink6Description: https://datasheet.octopart.com:443/RT1206BRD071K15L-Yageo-datasheet-137700930.pdf?src-supplier=Future+Electronics; ComponentLink7URL: https://datasheet.octopart.com:443/RT1206BRD071K15L-Yageo-datasheet-68361100.pdf?src-supplier=Future+Electronics; ComponentLink7Description: https://datasheet.octopart.com:443/RT1206BRD071K15L-Yageo-datasheet-68361100.pdf?src-supplier=Future+Electronics; ComponentLink8URL: https://datasheet.octopart.com:443/RT1206BRD071K15L-Yageo-datasheet-41589729.pdf?src-supplier=Future+Electronics; ComponentLink8Description: https://datasheet.octopart.com:443/RT1206BRD071K15L-Yageo-datasheet-41589729.pdf?src-supplier=Future+Electronics; ComponentLink9URL: https://datasheet.octopart.com:443/RT1206BRD071K15L-Yageo-datasheet-12594463.pdf?src-supplier=Future+Electronics; ComponentLink9Description: https://datasheet.octopart.com:443/RT1206BRD071K15L-Yageo-datasheet-12594463.pdf?src-supplier=Future+Electronics; ComponentLink10URL: https://datasheet.octopart.com:443/RT1206BRD071K15L-Yageo-datasheet-34924148.pdf?src-supplier=Future+Electronics; ComponentLink10Description: https://datasheet.octopart.com:443/RT1206BRD071K15L-Yageo-datasheet-34924148.pdf?src-supplier=Future+Electronics; ComponentLink11URL: https://datasheet.octopart.com:443/RT1206BRD071K15L-Yageo-Group-datasheet-141265893.pdf?src-supplier=ODG+(Origin+Data+Global); ComponentLink11Description: https://datasheet.octopart.com:443/RT1206BRD071K15L-Yageo-Group-datasheet-141265893.pdf?src-supplier=ODG+(Origin+Data+Global); ComponentLink12URL: https://datasheet.octopart.com/RT1206BRD071K15L-Yageo-datasheet-86813807.pdf; ComponentLink12Description: https://datasheet.octopart.com/RT1206BRD071K15L-Yageo-datasheet-86813807.pdf; ComponentLink13URL: http://sigma.octopart.com:80/rohs_statement/Yageo-company-2.pdf?src-supplier=Compliance+Statements; ComponentLink13Description: http://sigma.octopart.com:80/rohs_statement/Yageo-company-2.pdf?src-supplier=Compliance+Statements; ComponentLink14URL: http://sigma.octopart.com:80/conflict_mineral_statement/Yageo-company-3.pdf?src-supplier=Compliance+Statements; ComponentLink14Description: http://sigma.octopart.com:80/conflict_mineral_statement/Yageo-company-3.pdf?src-supplier=Compliance+Statements
R31 = MCA12060D8000BP500: RES 800 OHM 0.1% 1/4W 1206; Manufacturer: Vishay; Item Type: Resistors; Max Power Dissipation: 250mW; Value: 800Ω; Temperature Coefficient: 25ppm/°C; Voltage Rating: 200V; Supplier: Mouser; LCSC Part Number: C1711801; Manufacturer Part Number: MCA12060D8000BP500; RoHS: Compliant; Stock: 4940; Pricing: 1=0.74, 10=0.53, 50=0.53, 100=0.359, 1000=0.297, 10000=0.246 (USD); Case/Package: 1206; Composition: Thin Film; Height: 550µm; Lead Free: Lead Free; Lifecycle Status: Production; Max Operating Temperature: 125°C; Min Operating Temperature: -55°C; Mounting Technology: Surface Mount; Number of Terminals: 2; Number of Terminations: 2; Packaging: Tape & Reel (TR); Power Dissipation: 250mW; Power Rating: 250mW; Tolerance: 0.1%; Width: 1.6mm; Working Voltage: 200V; ComponentLink1URL: https://datasheet.octopart.com:443/MCA12060D8000BP500-Vishay-datasheet-182027962.pdf?src-supplier=IHS; ComponentLink1Description: https://datasheet.octopart.com:443/MCA12060D8000BP500-Vishay-datasheet-182027962.pdf?src-supplier=IHS; ComponentLink2URL: https://datasheet.octopart.com:443/MCA12060D8000BP500-Vishay-datasheet-101751591.pdf?src-supplier=Upverter; ComponentLink2Description: https://datasheet.octopart.com:443/MCA12060D8000BP500-Vishay-datasheet-101751591.pdf?src-supplier=Upverter; ComponentLink3URL: https://datasheet.octopart.com/MCA12060D8000BP500-Vishay-datasheet-13186682.pdf; ComponentLink3Description: https://datasheet.octopart.com/MCA12060D8000BP500-Vishay-datasheet-13186682.pdf; ComponentLink4URL: https://datasheet.octopart.com/MCA12060D8000BP500-Vishay-datasheet-13199943.pdf; ComponentLink4Description: https://datasheet.octopart.com/MCA12060D8000BP500-Vishay-datasheet-13199943.pdf; ComponentLink5URL: https://datasheet.octopart.com/MCA12060D8000BP500-Vishay-datasheet-12542476.pdf; ComponentLink5Description: https://datasheet.octopart.com/MCA12060D8000BP500-Vishay-datasheet-12542476.pdf; ComponentLink6URL: https://datasheet.octopart.com/MCA12060D8000BP500-Vishay-datasheet-12534580.pdf; ComponentLink6Description: https://datasheet.octopart.com/MCA12060D8000BP500-Vishay-datasheet-12534580.pdf; ComponentLink7URL: https://datasheet.octopart.com/MCA12060D8000BP500-Vishay-datasheet-12520137.pdf; ComponentLink7Description: https://datasheet.octopart.com/MCA12060D8000BP500-Vishay-datasheet-12520137.pdf; ComponentLink8URL: https://datasheet.octopart.com/MCA12060D8000BP500-Vishay-datasheet-12510451.pdf; ComponentLink8Description: https://datasheet.octopart.com/MCA12060D8000BP500-Vishay-datasheet-12510451.pdf; ComponentLink9URL: http://sigma.octopart.com:80/rohs_statement/Vishay-company-15.pdf?src-supplier=Compliance+Statements; ComponentLink9Description: http://sigma.octopart.com:80/rohs_statement/Vishay-company-15.pdf?src-supplier=Compliance+Statements
R33 = 4D03WGJ0103T5E: 4 ±5% 10kΩ 62.5mW ±200ppm/℃ 0603x4 Resistor Networks, Arrays ROHS; Manufacturer: Royal Electronic Factory; Value: 10kR; Temperature Coefficient: 400ppm/°C; Supplier: Mouser; LCSC Part Number: C29718; Manufacturer Part Number: 4D03WGJ0103T5E; RoHS: No; Item Type: Resistor; Pricing: 10000=0.005 (USD); ComponentLink1URL: https://datasheet.octopart.com/4D03WGJ0103T5E-Royal-Ohm-datasheet-158295248.pdf?src-supplier=TME; ComponentLink1Description: https://datasheet.octopart.com/4D03WGJ0103T5E-Royal-Ohm-datasheet-158295248.pdf?src-supplier=TME
R36 = FRC1206F47R0TS: 250mW Thick Film Resistors 200V ±100ppm/℃ ±1% 47Ω 1206 Chip Resistor - Surface Mount ROHS; Manufacturer: FOJAN; Manufacturer Part Number: FRC1206F47R0TS; Package: 1206; LCSC Part Number: C2933712; Item Type: Resistor; ComponentLink1Description: LCSC; ComponentLink1URL: https://www.lcsc.com/product-detail/Chip-Resistor-Surface-Mount_FOJAN-FRC1206F47R0TS_C2933712.html
R37 = YC164-JR-07100KL: RES ARRAY 4 RES 100K OHM 1206; Manufacturer: Yageo; Item Type: Resistor; Supplier: Future Electronics; Supplier Part Number: 4734737; Manufacturer Part Number: YC164-JR-07100KL; RoHS: Yes; Category: Resistor Arrays; Stock: 10000; Pricing: 5000=0.0086, 20000=0.0082, 50000=0.0078, 100000=0.0078, 125000=0.0075, 200000=0.0076, 625000=0.0071 (USD); ComponentLink1URL: https://datasheet.ciiva.com/11807/0900766b80c69e1d-11807026.pdf?src-supplier=Rs; ComponentLink1Description: https://datasheet.ciiva.com/11807/0900766b80c69e1d-11807026.pdf?src-supplier=Rs; ComponentLink2URL: https://datasheet.ciiva.com/8017/443424-8017993.pdf?src-supplier=Element14; ComponentLink2Description: https://datasheet.ciiva.com/8017/443424-8017993.pdf?src-supplier=Element14; ComponentLink3URL: https://datasheet.ciiva.com/8017/443424-8017994.pdf?src-supplier=Element14; ComponentLink3Description: https://datasheet.ciiva.com/8017/443424-8017994.pdf?src-supplier=Element14; ComponentLink4URL: https://datasheet.ciiva.com/17478/pyu-yc-tc164-51-rohs-l-3-17478885.pdf?src-supplier=Future+Electronics; ComponentLink4Description: https://datasheet.ciiva.com/17478/pyu-yc-tc164-51-rohs-l-3-17478885.pdf?src-supplier=Future+Electronics; ComponentLink5URL: https://datasheet.ciiva.com/2693/pyu-yc-tc164-51-rohs-l-3-2693249.pdf?src-supplier=Digi-Key; ComponentLink5Description: https://datasheet.ciiva.com/2693/pyu-yc-tc164-51-rohs-l-3-2693249.pdf?src-supplier=Digi-Key; ComponentLink6URL: https://datasheet.ciiva.com/2693/pyu-yc-tc164-51-rohs-l-3-2693250.pdf?src-supplier=Digi-Key; ComponentLink6Description: https://datasheet.ciiva.com/2693/pyu-yc-tc164-51-rohs-l-3-2693250.pdf?src-supplier=Digi-Key; ComponentLink7URL: https://datasheet.ciiva.com/2693/pyu-yc-tc164-51-rohs-l-3-2693251.pdf?src-supplier=Digi-Key; ComponentLink7Description: https://datasheet.ciiva.com/2693/pyu-yc-tc164-51-rohs-l-3-2693251.pdf?src-supplier=Digi-Key; LCSC Part Number: C192933
SW4 = SMXS-06K-TP: 6 digits 24V Black 25mA 3000 Times SMD DIP Switches ROHS; Manufacturer: SM Switch; Manufacturer Part Number: SMXS-06K-TP; Package: SMD; LCSC Part Number: C5439765; Item Type: DIP SWITCH; ComponentLink1Description: LCSC; ComponentLink1URL: https://www.lcsc.com/product-detail/DIP-Switches_SM-Switch-SMXS-06K-TP_C5439765.html
U3 U4 = SFH6156-2: OPTOISOLATOR 5.3KV TRANS 4SMD; Manufacturer: Vishay; Item Type: IC; Supplier: Mouser; LCSC Part Number: C5156027; Manufacturer Part Number: SFH6156-2; RoHS: No; Stock: 11480; Pricing: 1=0.56, 10=0.37, 50=0.37, 100=0.253, 1000=0.218, 10000=0.217 (USD)
U5 U6 = DMP2305U-7: MOSFET P-CH 20V 4.2A SOT23-3; Manufacturer: Diodes Zetex; Item Type: MOSFETs; Supplier: Future Electronics; LCSC Part Number: C85097; Manufacturer Part Number: DMP2305U-7; RoHS: Yes; Stock: 207000; Pricing: 3000=0.0412, 9000=0.0402, 15000=0.0398, 45000=0.0388, 75000=0.038 (USD); ComponentLink1URL: https://datasheet.ciiva.com/13059/ds31737-52560-13059868.pdf?src-supplier=Mouser; ComponentLink1Description: https://datasheet.ciiva.com/13059/ds31737-52560-13059868.pdf?src-supplier=Mouser; ComponentLink2URL: https://datasheet.ciiva.com/11176/ds31737-11176455.pdf?src-supplier=Avnet; ComponentLink2Description: https://datasheet.ciiva.com/11176/ds31737-11176455.pdf?src-supplier=Avnet
U7 = XC61CC3002PR-G: Supervisory Circuits; Manufacturer: Torex; Item Type: IC; Manufacturer Part Number: XC61CC3002PR-G; Package: SOT-89; LCSC Part Number: -; ComponentLink1Description: Torex; ComponentLink1URL: https://direct.torexsemi.com/en-us/product/xc61c/xc61cc3002pr-g